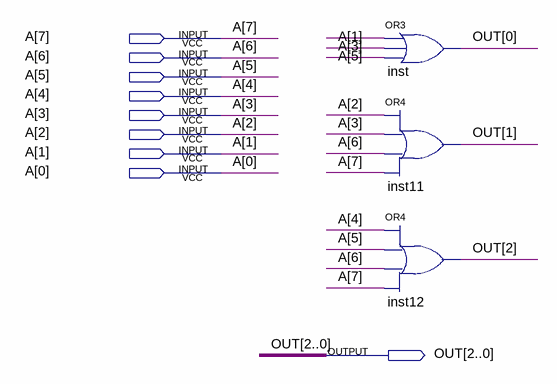
[diagram p0: schematic sheet]
// Quartus schematic 8_3trans.bdf as structural Verilog: 3 symbols, 9 pins
module \8_3trans  (
  input  [7:0] A,
  output [2:0] OUT
);

  or inst (OUT[0], A[1], A[3], A[5]);
  or inst11 (OUT[1], A[2], A[3], A[6], A[7]);
  or inst12 (OUT[2], A[4], A[5], A[6], A[7]);
endmodule
